# Altium schematic sheet Proposed_Prototype.SchDoc
size A; SheetNumber: 5; SheetTotal: 5
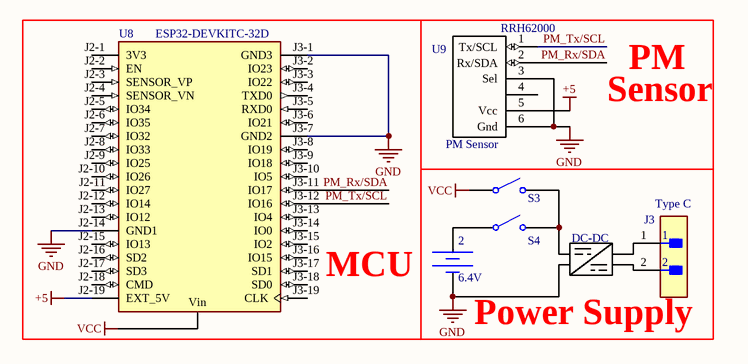
[diagram p0: Proposed_Prototype.SchDoc]

## Parts
2  DC Magnitude: 6.4V  (hidden comment: Constant Voltage Source)
J3  Type C  [FP-TSW-102-22-G-S-MFG]
S3  Single-Pole, Single-Throw Switch  (value not drawn)
S4  Single-Pole, Single-Throw Switch  (value not drawn)
U8  ESP32-DEVKITC-32D  [MODULE_ESP32-DEVKITC-32D]
U9  PM Sensor  [RRH62000]

## Blocks framed on the sheet
MCU: U8

## Nets
+5: U8.J2-19(EXT_5V) U9.5(Vcc)
GND: 2.2 U8.J2-14(GND1) U8.J3-1(GND3) U8.J3-7(GND2) U9.3(Sel) U9.6(Gnd)
VCC: S3.1
PM_Rx/SDA: U8.J3-11(IO17) U9.2(Rx/SDA)
PM_Tx/SCL: U8.J3-12(IO16) U9.1(Tx/SCL)
Net2_1: 2.1 S4.1
NetS3_2: S3.2 S4.2

Not connected (* = marked no-connect by the designer): J3 1 2; U8 J2-1(3V3) J2-2(EN) J2-3(SENSOR_VP) J2-4(SENSOR_VN) J2-5(IO34) J2-6(IO35) J2-7(IO32) J2-8(IO33) J2-9(IO25) J2-10(IO26) J2-11(IO27) J2-12(IO14) J2-13(IO12) J2-15(IO13) J2-16(SD2) J2-17(SD3) J2-18(CMD) J3-2(IO23) J3-3(IO22) J3-4(TXD0) J3-5(RXD0) J3-6(IO21) J3-8(IO19) J3-9(IO18) J3-10(IO5) J3-13(IO4) J3-14(IO0) J3-15(IO2) J3-16(IO15) J3-17(SD1) J3-18(SD0) J3-19(CLK); U9 4

## Notes on the sheet
- PM
- Sensor
- DC-DC
- (near U8) Vin
- Power Supply

## Library data of the parts
2 = Battery: SimulationGenericComponent: True
J3 = CMP-02766-000117-1: CONN HEADER VERT 2POS 2.54MM; Max Voltage Rating (AC): 550V; Gender: Male; Max Current Rating: 7.6A; Number of Contacts: 2; Housing Color: Black; Max Operating Temperature: 125°C; Orientation: Straight; Depth: 2.54mm; Pitch: 2.54mm; Housing Material: Polyester; Packaging: Bulk; Termination: Solder; Contact Plating: Gold; Length: 5.08mm; Number of Rows: 1; Radiation Hardening: No; Min Operating Temperature: -55°C; REACH SVHC: No SVHC; Contact Material: Bronze
S3 S4 = SPST SW: closed: 0; Rclosed: 1m; Ropen: 1Meg; SimulationGenericComponent: True
U8 = ESP32-DEVKITC-32D: WiFi Development Tools (802.11) ESP32 General Development Kit, ESP32-WROOM-32D on the board; MF: Espressif Systems; SnapEDA_Link: https://www.snapeda.com/parts/ESP32-DEVKITC-32D/Espressif+Systems/view-part/?ref=snap; Package: None; Value: *; MP: ESP32-DEVKITC-32D; Check_prices: https://www.snapeda.com/parts/ESP32-DEVKITC-32D/Espressif+Systems/view-part/?ref=eda
U9 = RRH62000